# Altium schematic sheet Top_Sheet.SchDoc
size A4; DocumentNumber: 1; SheetNumber: 1; SheetTotal: 5
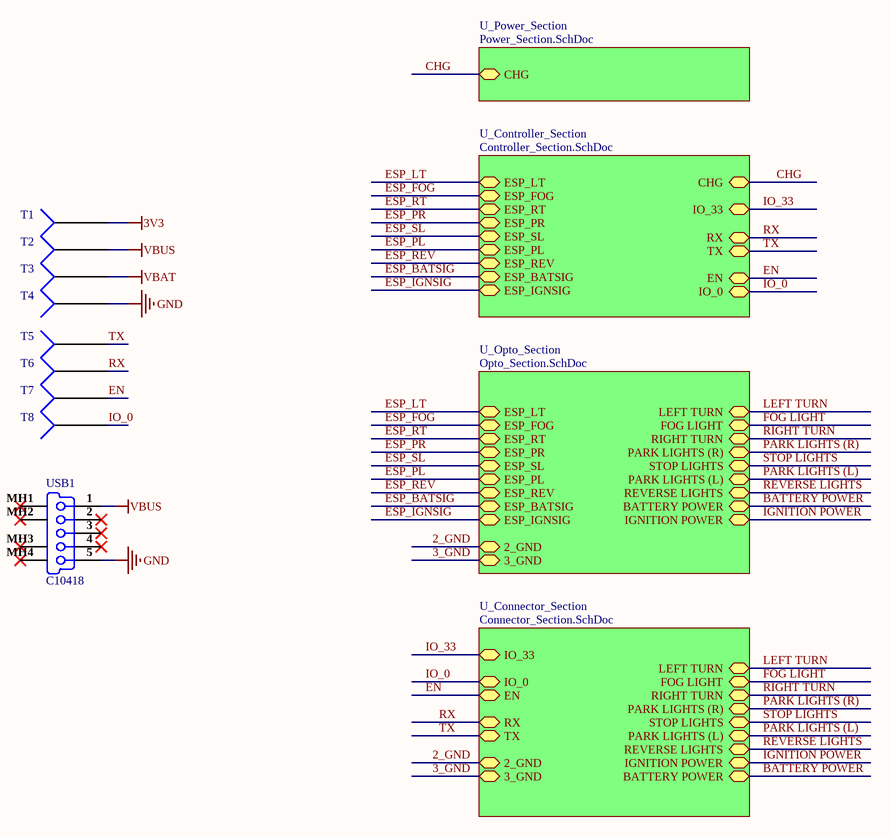
[diagram p0: Top_Sheet.SchDoc]

## Parts
T1  Socket  [Socket]  (value not drawn)
T2  Socket  [Socket]  (value not drawn)
T3  Socket  [Socket]  (value not drawn)
T4  Socket  [Socket]  (value not drawn)
T5  Socket  [Socket]  (value not drawn)
T6  Socket  [Socket]  (value not drawn)
T7  Socket  [Socket]  (value not drawn)
T8  Socket  [Socket]  (value not drawn)
USB1  C10418  [C10418]

## Sub-sheets
U_Connector_Section = Connector_Section.SchDoc: IO_33 (bidir), RX (bidir), TX (bidir), IO_0 (bidir), EN (bidir), 3_GND (bidir), 2_GND (bidir), BATTERY POWER (bidir), REVERSE LIGHTS (bidir), IGNITION POWER (bidir), PARK LIGHTS (L) (bidir), STOP LIGHTS (bidir), PARK LIGHTS (R) (bidir), RIGHT TURN (bidir), FOG LIGHT (bidir), LEFT TURN (bidir)
U_Controller_Section = Controller_Section.SchDoc: CHG (bidir), IO_33 (bidir), RX (bidir), TX (bidir), EN (bidir), IO_0 (bidir), ESP_REV (bidir), ESP_PL (bidir), ESP_BATSIG (bidir), ESP_SL (bidir), ESP_PR (bidir), ESP_RT (bidir), ESP_IGNSIG (bidir), ESP_FOG (bidir), ESP_LT (bidir)
U_Opto_Section = Opto_Section.SchDoc: 3_GND (bidir), 2_GND (bidir), LEFT TURN (bidir), PARK LIGHTS (L) (bidir), REVERSE LIGHTS (bidir), STOP LIGHTS (bidir), BATTERY POWER (bidir), IGNITION POWER (bidir), PARK LIGHTS (R) (bidir), FOG LIGHT (bidir), RIGHT TURN (bidir), ESP_PL (bidir), ESP_LT (bidir), ESP_RT (bidir), ESP_BATSIG (bidir), ESP_SL (bidir), ESP_REV (bidir), ESP_IGNSIG (bidir), ESP_FOG (bidir), ESP_PR (bidir)
U_Power_Section = Power_Section.SchDoc: CHG (bidir)

## Nets
3V3: T1.1
GND: T4.1 USB1.5(GND)
VBAT: T3.1
VBUS: T2.1 USB1.1(V_BUS_(5V))
2_GND: sheet U_Opto_Section/2_GND, sheet U_Connector_Section/2_GND
3_GND: sheet U_Opto_Section/3_GND, sheet U_Connector_Section/3_GND
BATTERY POWER: sheet U_Opto_Section/BATTERY POWER, sheet U_Connector_Section/BATTERY POWER
CHG: sheet U_Power_Section/CHG, sheet U_Controller_Section/CHG
EN: T7.1 ; sheet U_Controller_Section/EN, sheet U_Connector_Section/EN
ESP_BATSIG: sheet U_Controller_Section/ESP_BATSIG, sheet U_Opto_Section/ESP_BATSIG
ESP_FOG: sheet U_Controller_Section/ESP_FOG, sheet U_Opto_Section/ESP_FOG
ESP_IGNSIG: sheet U_Controller_Section/ESP_IGNSIG, sheet U_Opto_Section/ESP_IGNSIG
ESP_LT: sheet U_Controller_Section/ESP_LT, sheet U_Opto_Section/ESP_LT
ESP_PL: sheet U_Controller_Section/ESP_PL, sheet U_Opto_Section/ESP_PL
ESP_PR: sheet U_Controller_Section/ESP_PR, sheet U_Opto_Section/ESP_PR
ESP_REV: sheet U_Controller_Section/ESP_REV, sheet U_Opto_Section/ESP_REV
ESP_RT: sheet U_Controller_Section/ESP_RT, sheet U_Opto_Section/ESP_RT
ESP_SL: sheet U_Controller_Section/ESP_SL, sheet U_Opto_Section/ESP_SL
FOG LIGHT: sheet U_Opto_Section/FOG LIGHT, sheet U_Connector_Section/FOG LIGHT
IGNITION POWER: sheet U_Opto_Section/IGNITION POWER, sheet U_Connector_Section/IGNITION POWER
IO_0: T8.1 ; sheet U_Controller_Section/IO_0, sheet U_Connector_Section/IO_0
IO_33: sheet U_Controller_Section/IO_33, sheet U_Connector_Section/IO_33
LEFT TURN: sheet U_Opto_Section/LEFT TURN, sheet U_Connector_Section/LEFT TURN
PARK LIGHTS (L): sheet U_Opto_Section/PARK LIGHTS (L), sheet U_Connector_Section/PARK LIGHTS (L)
PARK LIGHTS (R): sheet U_Opto_Section/PARK LIGHTS (R), sheet U_Connector_Section/PARK LIGHTS (R)
REVERSE LIGHTS: sheet U_Opto_Section/REVERSE LIGHTS, sheet U_Connector_Section/REVERSE LIGHTS
RIGHT TURN: sheet U_Opto_Section/RIGHT TURN, sheet U_Connector_Section/RIGHT TURN
RX: T6.1 ; sheet U_Controller_Section/RX, sheet U_Connector_Section/RX
STOP LIGHTS: sheet U_Opto_Section/STOP LIGHTS, sheet U_Connector_Section/STOP LIGHTS
TX: T5.1 ; sheet U_Controller_Section/TX, sheet U_Connector_Section/TX

Not connected (* = marked no-connect by the designer): USB1 2(D-)* 3(D+)* 4(NC)* MH1(Tab)* MH2(Tab)* MH3(Tab)* MH4(Tab)*

## Library data of the parts
USB1 = C10418: USB - Micro B Female USB 2 5 SMD USB Connectors RoHS; Manufacturer: Jing Extension of the Electronic Co.; Gender: Receptacle; Connector Type: USB,Receptacle; Number of Contacts: 5; Number of Ports: 1; Manufacturer Part Number: C10418; Mount: Surface Mount,Horizontal; Number of Terminals: 5; Termination: Solder; Orientation: Right Angle; ComponentLink1URL: http://www.amphenol-icc.com/media/wysiwyg/files/drawing/10118194.pdf?src-supplier=Digi-Key; ComponentLink1Description: http://www.amphenol-icc.com/media/wysiwyg/files/drawing/10118194.pdf?src-supplier=Digi-Key; ComponentLink2URL: https://cdn.amphenol-icc.com/media/wysiwyg/files/drawing/10118194.pdf?src-supplier=Mouser; ComponentLink2Description: https://cdn.amphenol-icc.com/media/wysiwyg/files/drawing/10118194.pdf?src-supplier=Mouser; ComponentLink3URL: https://cdn.amphenol-icc.com/media/wysiwyg/files/drawing/10118194.pdf?src-supplier=Verical; ComponentLink3Description: https://cdn.amphenol-icc.com/media/wysiwyg/files/drawing/10118194.pdf?src-supplier=Verical; Link: https://lcsc.com/product-detail/USB-Connectors_Jing-Extension-of-the-Electronic-Co-C10418_C10418.html
T1-T8 = Socket: LatestRevisionDate: 17-Jul-2002; LatestRevisionNote: Re-released for DXP Platform.; Publisher: Altium Limited